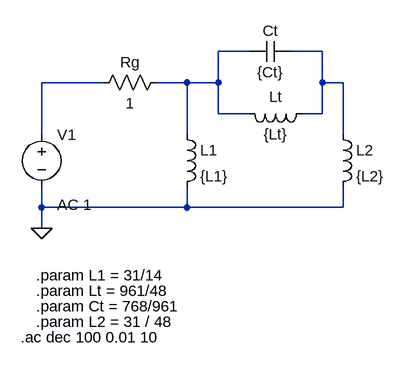
[diagram p0: schematic punto1.asc]
punto1.asc, the LTspice schematic file:
Version 4.1
SHEET 1 880 680
WIRE 272 0 224 0
WIRE 384 0 336 0
WIRE 48 48 -48 48
WIRE 176 48 128 48
WIRE 224 48 224 0
WIRE 224 48 176 48
WIRE 384 48 384 0
WIRE 416 48 384 48
WIRE 224 96 224 48
WIRE 272 96 224 96
WIRE 384 96 384 48
WIRE 384 96 352 96
WIRE -48 128 -48 48
WIRE 176 128 176 48
WIRE 416 128 416 48
WIRE -48 240 -48 208
WIRE 176 240 176 208
WIRE 176 240 -48 240
WIRE 416 240 416 208
WIRE 416 240 176 240
WIRE -48 272 -48 240
FLAG -48 272 0
SYMBOL voltage -48 112 R0
WINDOW 123 24 124 Left 2
WINDOW 39 0 0 Left 0
SYMATTR Value2 AC 1
SYMATTR InstName V1
SYMATTR Value ""
SYMBOL res 144 32 R90
WINDOW 0 0 56 VBottom 2
WINDOW 3 32 56 VTop 2
SYMATTR InstName Rg
SYMATTR Value 1
SYMBOL ind 160 112 R0
SYMATTR InstName L1
SYMATTR Value {L1}
SYMATTR SpiceLine Rser=1m
SYMBOL ind 368 80 R90
WINDOW 0 5 56 VBottom 2
WINDOW 3 32 56 VTop 2
SYMATTR InstName Lt
SYMATTR Value {Lt}
SYMATTR SpiceLine Rser=1m
SYMBOL ind 400 112 R0
SYMATTR InstName L2
SYMATTR Value {L2}
SYMATTR SpiceLine Rser=1m
SYMBOL cap 336 -16 R90
WINDOW 0 0 32 VBottom 2
WINDOW 3 32 32 VTop 2
SYMATTR InstName Ct
SYMATTR Value {Ct}
TEXT -56 344 Left 2 !.param L1 = 31/14
TEXT -56 368 Left 2 !.param Lt = 961/48
TEXT -56 392 Left 2 !.param Ct = 768/961
TEXT -56 416 Left 2 !.param L2 = 31 / 48
TEXT -80 440 Left 2 !.ac dec 100 0.01 10

The netlist it stands for:
* punto1.asc
V1 N003 0 AC 1
Rg N001 N003 1
L1 N001 0 {L1} Rser=1m
Lt N002 N001 {Lt} Rser=1m
L2 N002 0 {L2} Rser=1m
Ct N002 N001 {Ct}
.param L1 = 31/14
.param Lt = 961/48
.param Ct = 768/961
.param L2 = 31 / 48
.ac dec 100 0.01 10
.backanno
.end